# Altium schematic sheet CM5_HighSpeed.SchDoc: 04 - CM5: conector 2 / 100 pinos
size A3; Project: CM5 Photonic Bias Controller; DocumentRev: R5; ProjectRev: R5; Version: Rev R6; SheetNumber: 5; SheetTotal: 17; Author: Carlos Renan; SCH_SCALE: N/A; Address1: UFCG; Address2: Referencia: VIRTUS CC; Address3: Campina Grande - PB; ProjectName: Controle automatico de BIAS para MZM/IQ - Projeto 3; DocumentName: CM5_HighSpeed.SchDoc
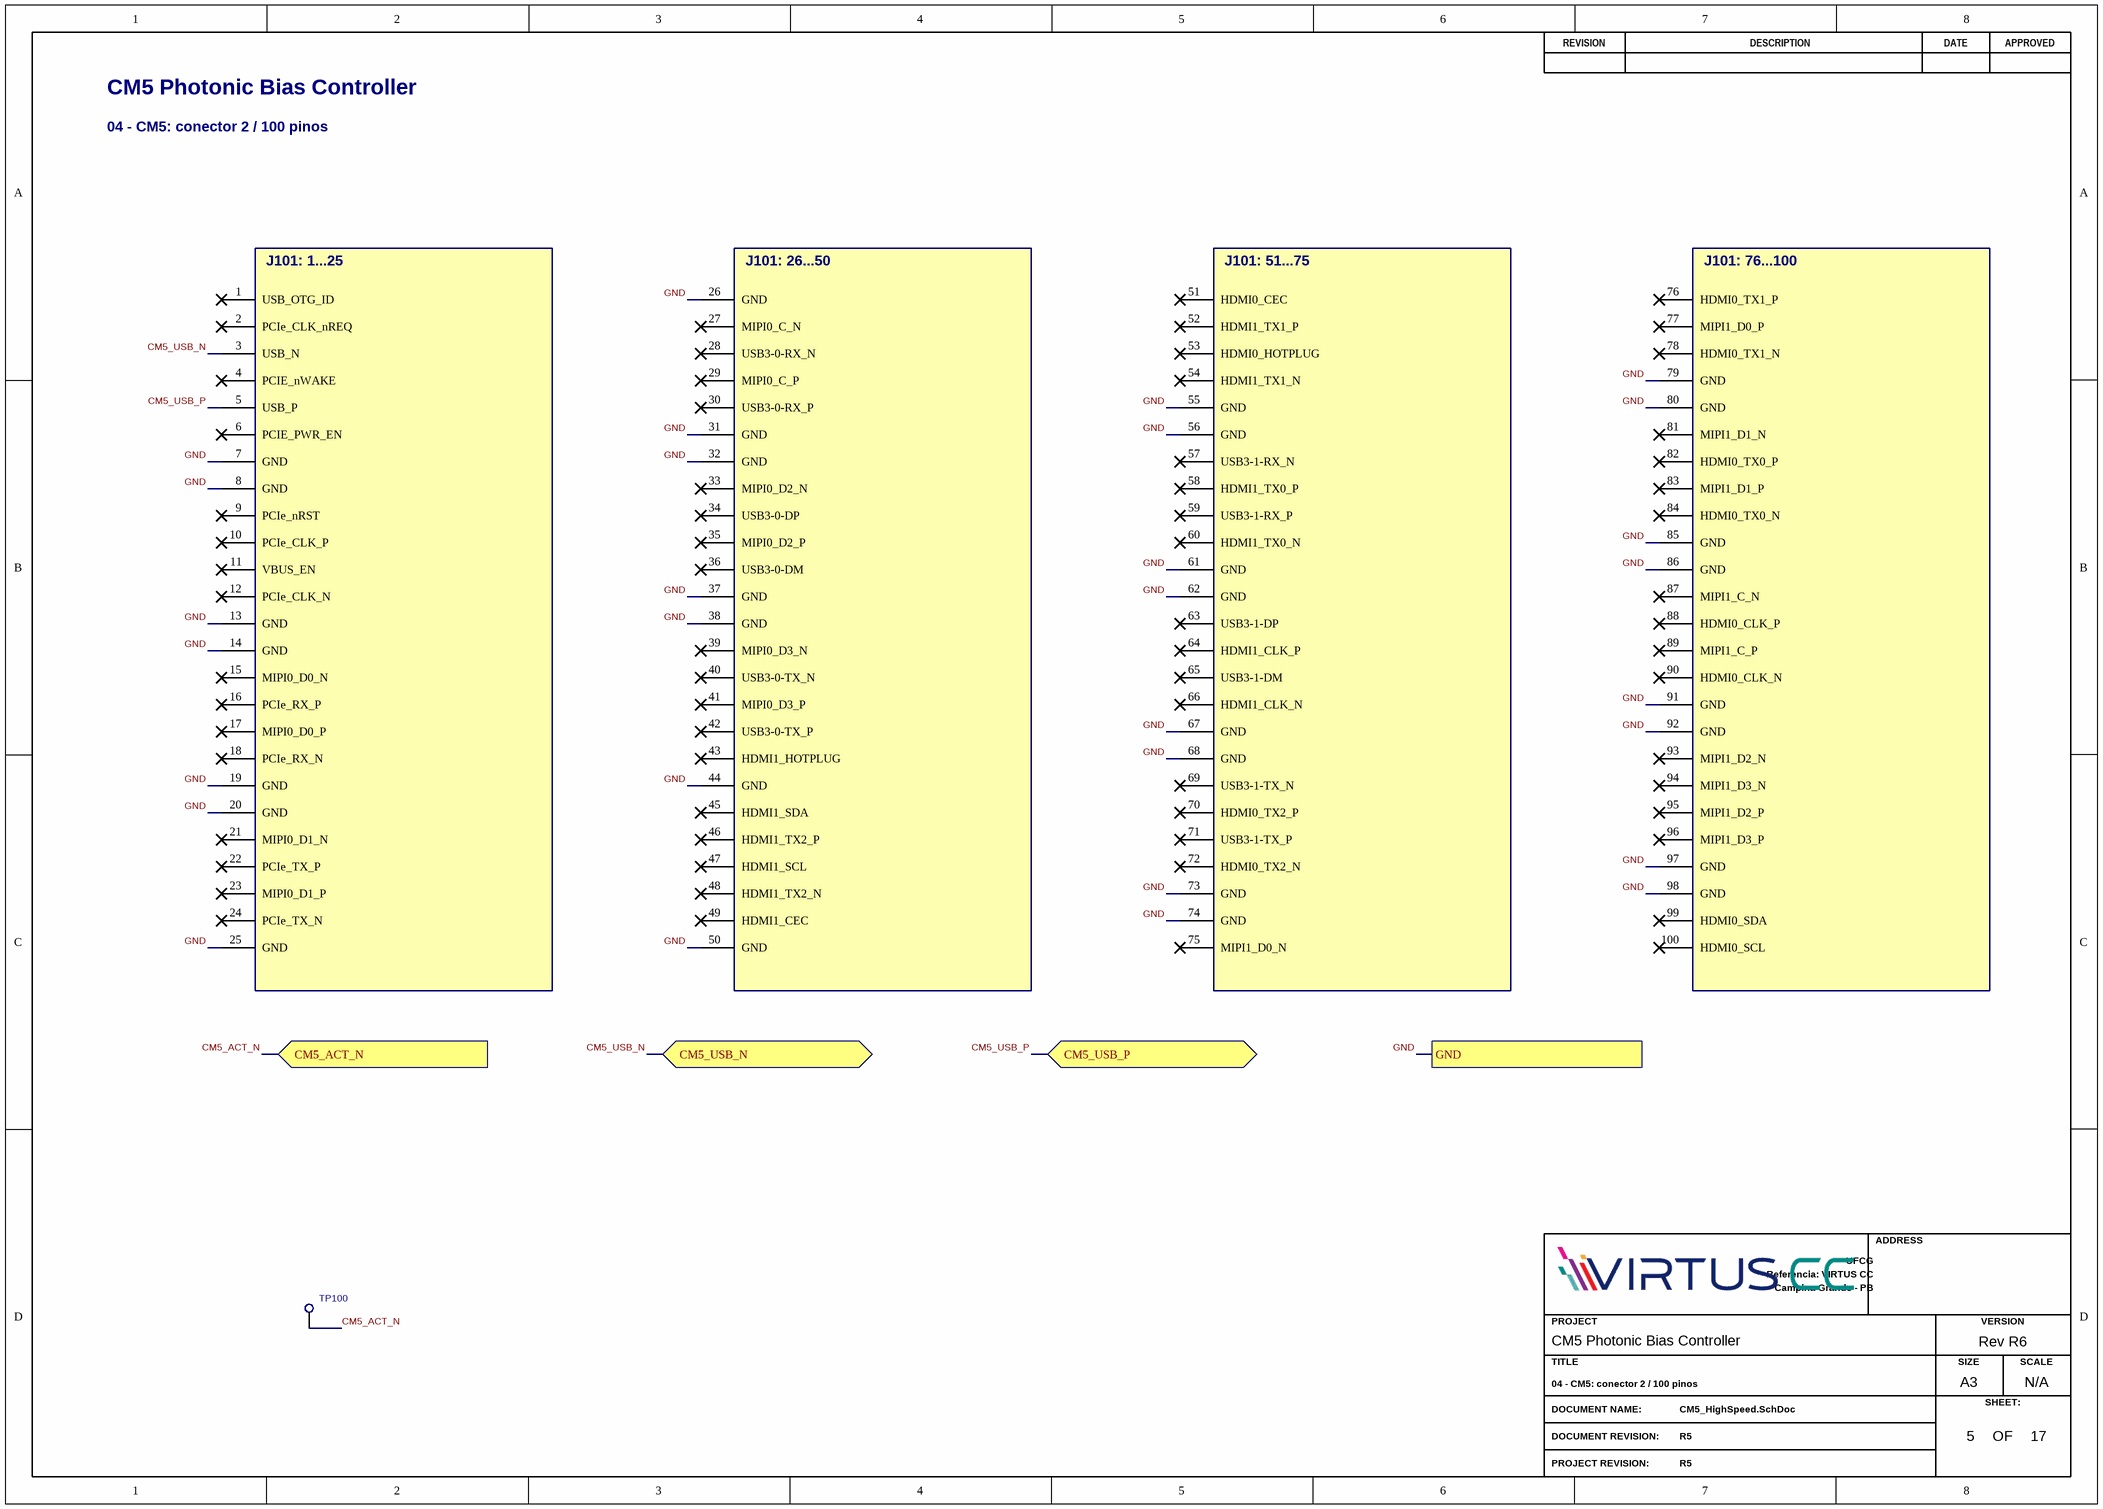
[diagram p0: CM5_HighSpeed.SchDoc]

## Parts
J101  CM5 carrier / 100 vias  [CM5_BERG100]  (value not drawn)
TP100  Testpoint  [TP06R]  (value not drawn)

## Ports
CM5_ACT_N (in), CM5_USB_N (bidir), CM5_USB_P (bidir), GND

## Nets
CM5_ACT_N: TP100.1(TP) ; port CM5_ACT_N
CM5_USB_N: J101.3(USB_N) ; port CM5_USB_N
CM5_USB_P: J101.5(USB_P) ; port CM5_USB_P
GND: J101.7(GND) J101.8(GND) J101.13(GND) J101.14(GND) J101.19(GND) J101.20(GND) J101.25(GND) J101.26(GND) J101.31(GND) J101.32(GND) J101.37(GND) J101.38(GND) J101.44(GND) J101.50(GND) J101.55(GND) J101.56(GND) J101.61(GND) J101.62(GND) J101.67(GND) J101.68(GND) J101.73(GND) J101.74(GND) J101.79(GND) J101.80(GND) J101.85(GND) J101.86(GND) J101.91(GND) J101.92(GND) J101.97(GND) J101.98(GND) ; port GND

Not connected (* = marked no-connect by the designer): J101 1(USB_OTG_ID)* 2(PCIe_CLK_nREQ)* 4(PCIE_nWAKE)* 6(PCIE_PWR_EN)* 9(PCIe_nRST)* 10(PCIe_CLK_P)* 11(VBUS_EN)* 12(PCIe_CLK_N)* 15(MIPI0_D0_N)* 16(PCIe_RX_P)* 17(MIPI0_D0_P)* 18(PCIe_RX_N)* 21(MIPI0_D1_N)* 22(PCIe_TX_P)* 23(MIPI0_D1_P)* 24(PCIe_TX_N)* 27(MIPI0_C_N)* 28(USB3-0-RX_N)* 29(MIPI0_C_P)* 30(USB3-0-RX_P)* 33(MIPI0_D2_N)* 34(USB3-0-DP)* 35(MIPI0_D2_P)* 36(USB3-0-DM)* 39(MIPI0_D3_N)* 40(USB3-0-TX_N)* 41(MIPI0_D3_P)* 42(USB3-0-TX_P)* 43(HDMI1_HOTPLUG)* 45(HDMI1_SDA)* 46(HDMI1_TX2_P)* 47(HDMI1_SCL)* 48(HDMI1_TX2_N)* 49(HDMI1_CEC)* 51(HDMI0_CEC)* 52(HDMI1_TX1_P)* 53(HDMI0_HOTPLUG)* 54(HDMI1_TX1_N)* 57(USB3-1-RX_N)* 58(HDMI1_TX0_P)* 59(USB3-1-RX_P)* 60(HDMI1_TX0_N)* 63(USB3-1-DP)* 64(HDMI1_CLK_P)* 65(USB3-1-DM)* 66(HDMI1_CLK_N)* 69(USB3-1-TX_N)* 70(HDMI0_TX2_P)* 71(USB3-1-TX_P)* 72(HDMI0_TX2_N)* 75(MIPI1_D0_N)* 76(HDMI0_TX1_P)* 77(MIPI1_D0_P)* 78(HDMI0_TX1_N)* 81(MIPI1_D1_N)* 82(HDMI0_TX0_P)* 83(MIPI1_D1_P)* 84(HDMI0_TX0_N)* 87(MIPI1_C_N)* 88(HDMI0_CLK_P)* 89(MIPI1_C_P)* 90(HDMI0_CLK_N)* 93(MIPI1_D2_N)* 94(MIPI1_D3_N)* 95(MIPI1_D2_P)* 96(MIPI1_D3_P)* 99(HDMI0_SDA)* 100(HDMI0_SCL)*

## Notes on the sheet
- CM5 Photonic Bias Controller
- 04 - CM5: conector 2 / 100 pinos
- REVISION
- DESCRIPTION
- DATE
- APPROVED
- ADDRESS
- PROJECT
- VERSION
- TITLE
- A3
- SIZE
- SCALE
- DOCUMENT NAME:
- DOCUMENT REVISION:
- OF
- SHEET:
- PROJECT REVISION:
- (in symbol CM5 carrier) J101: 1...25; J101: 26...50; J101: 51...75; J101: 76...100

## Library data of the parts
J101 = CM5 carrier: Manufacturer: Amphenol Communications Solutions; Manufacturer Part Number: 10164227-1004A1RLF; Review: 100 vias, passo 0,4 mm, empilhamento 4 mm. Pads locais 1..100; J101 corresponde aos pinos globais 101..200.; Procurement Status: Busca por MPN; SKU e disponibilidade a confirmar; BOM Purchase: Yes; Manufacturer 1: Amphenol Communications Solutions; Manufacturer Part Number 1: 10164227-1004A1RLF; Supplier 1: DigiKey; Supplier URL 1: https://www.digikey.com.br/pt/products/result?keywords=10164227-1004A1RLF; Supplier 2: Mouser; Supplier URL 2: https://br.mouser.com/c/?q=10164227-1004A1RLF; Datasheet: https://cdn.amphenol-cs.com/media/wysiwyg/files/drawing/10164227.pdf
TP100 = Testpoint: Review: Testpoint em cobre; excluido da BOM de compra.; Procurement Status: Recurso de cobre da PCB; nao comprar; BOM Purchase: No - PCB feature